# Altium schematic sheet 01_Power_Input.SchDoc
size 812 x 508 mm; SheetNumber: 1; SheetTotal: 16
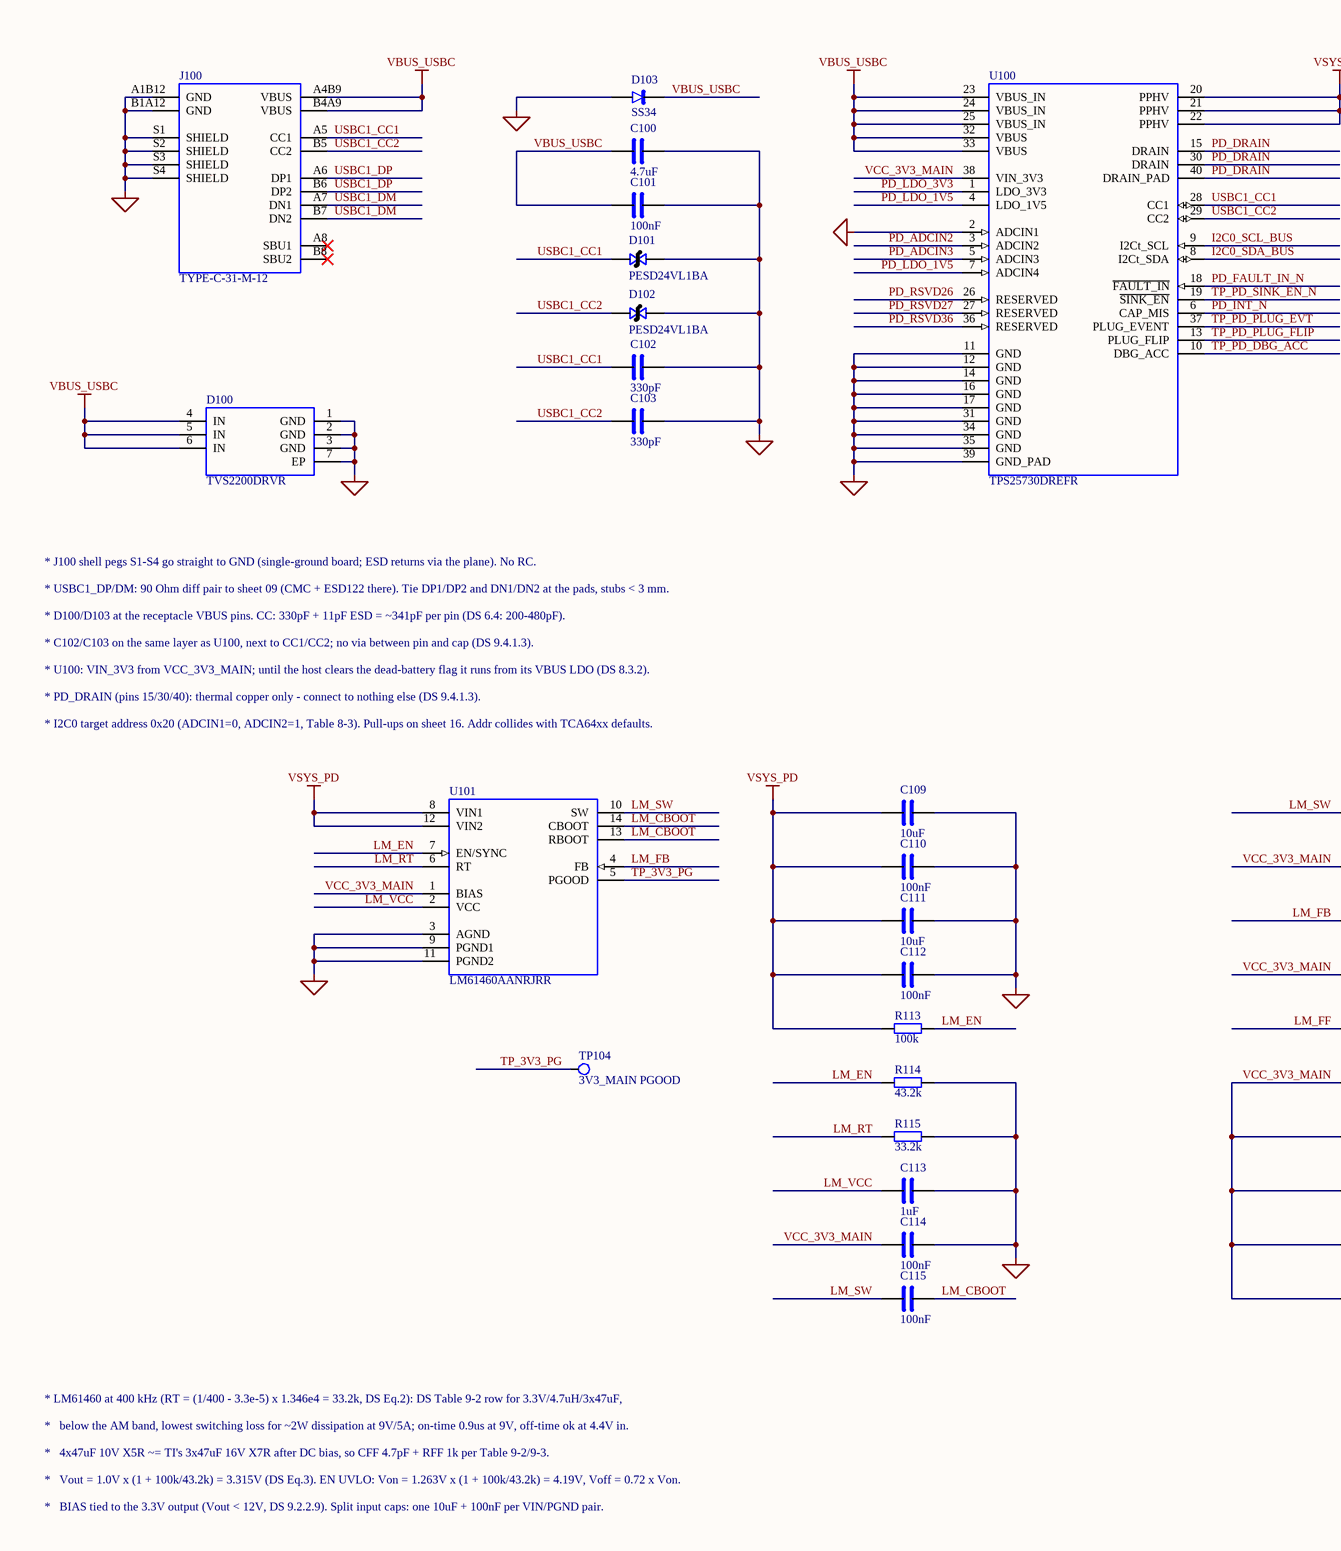
[diagram p0: 01_Power_Input.SchDoc, left]
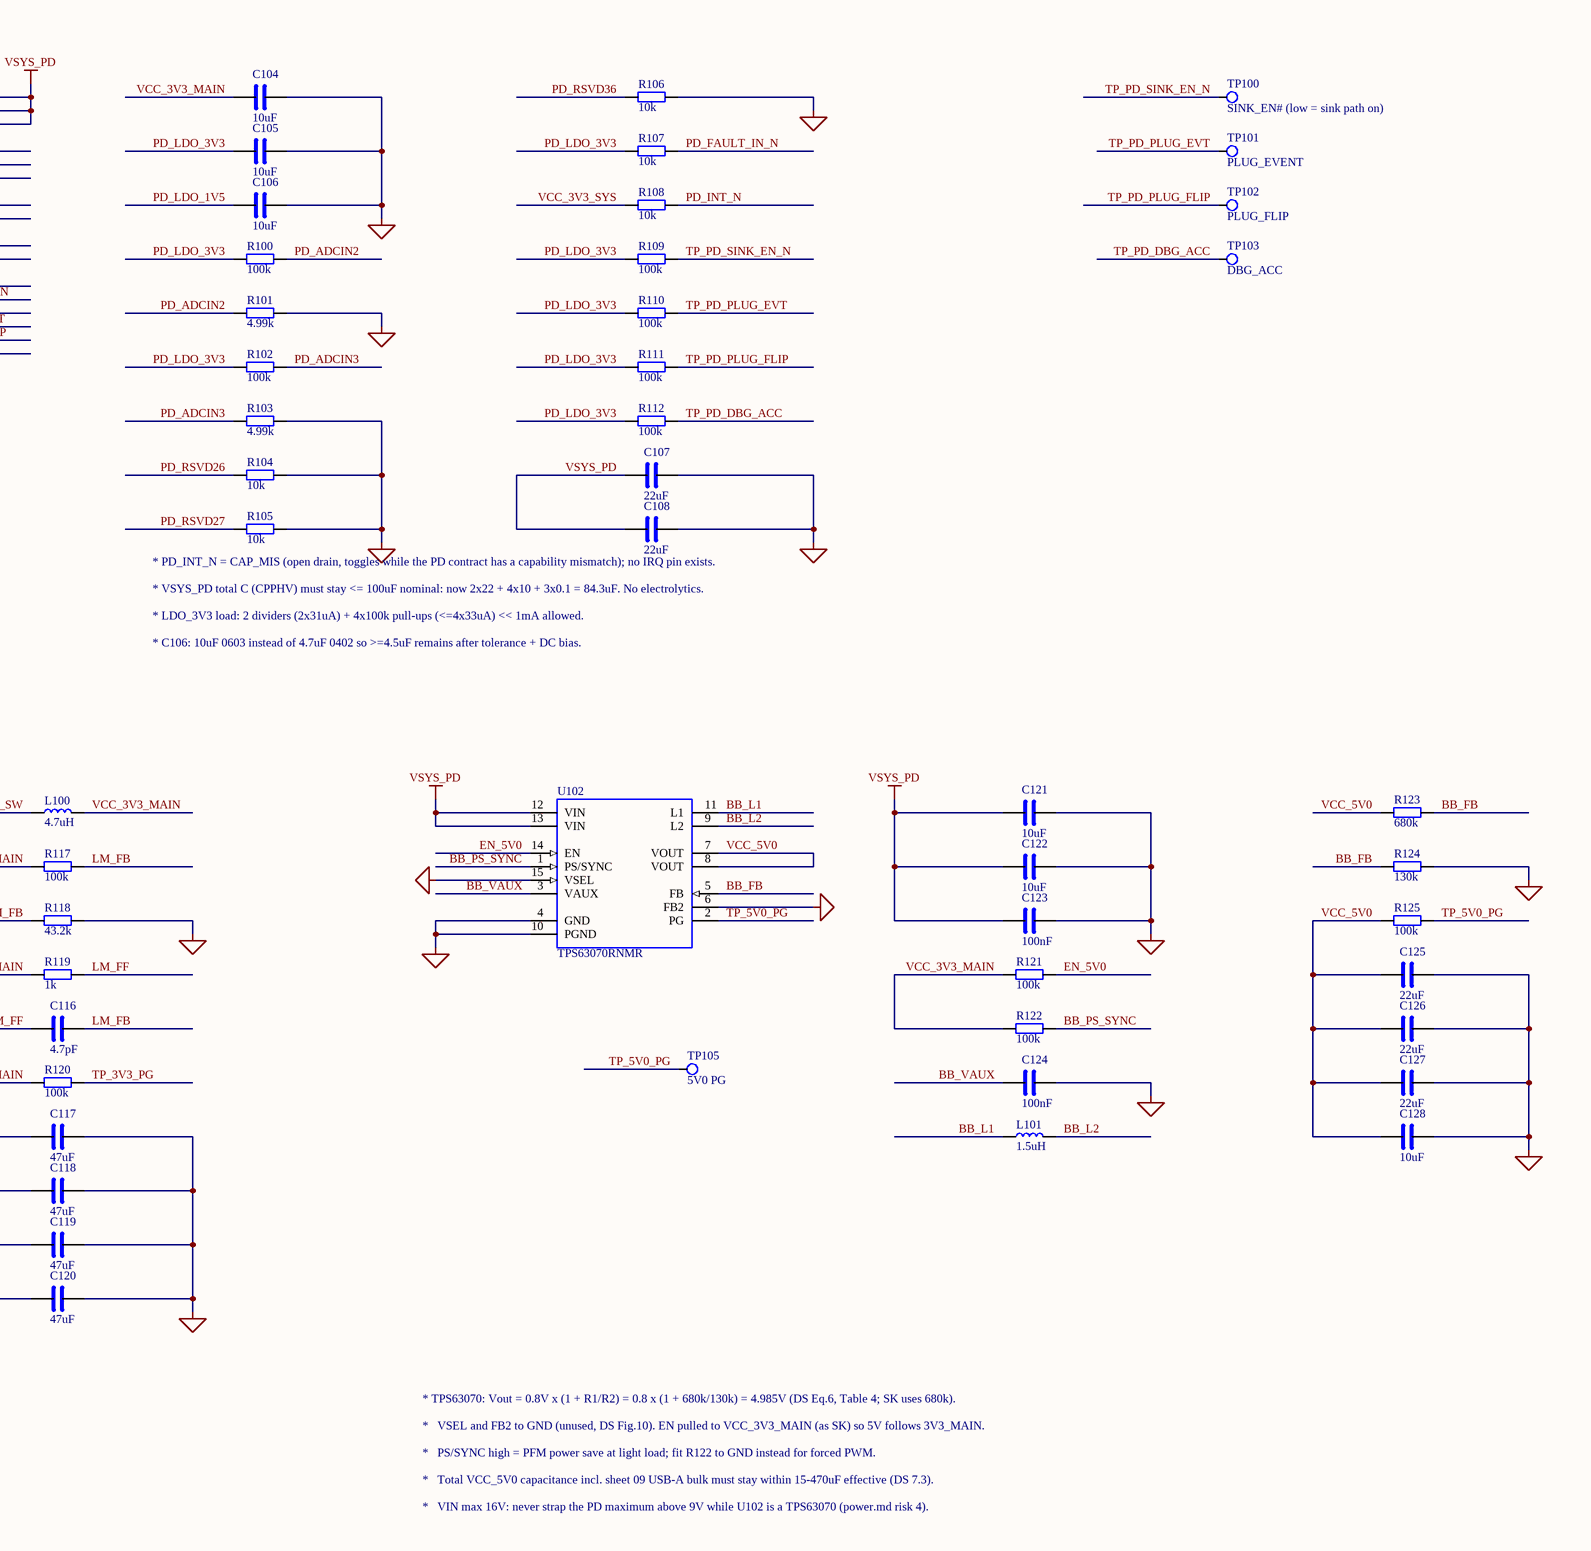
[diagram p1: 01_Power_Input.SchDoc, right]

## Parts
C100  4.7uF  [C0805]
C101  100nF  [C0603]
C102  330pF  [C0402]
C103  330pF  [C0402]
C104  10uF  [C0603]
C105  10uF  [C0603]
C106  10uF  [C0603]
C107  22uF  [C1206]
C108  22uF  [C1206]
C109  10uF  [C1206]
C110  100nF  [C0603]
C111  10uF  [C1206]
C112  100nF  [C0603]
C113  1uF  [C0402]
C114  100nF  [C0402]
C115  100nF  [C0402]
C116  4.7pF  [C0402]
C117  47uF  [C1206]
C118  47uF  [C1206]
C119  47uF  [C1206]
C120  47uF  [C1206]
C121  10uF  [C0805]
C122  10uF  [C0805]
C123  100nF  [C0603]
C124  100nF  [C0402]
C125  22uF  [C1206]
C126  22uF  [C1206]
C127  22uF  [C1206]
C128  10uF  [C0603]
D100  TVS2200DRVR  [WSON6_DRV_2X2]
D101  PESD24VL1BA  [SOD323]
D102  PESD24VL1BA  [SOD323]
D103  SS34  [DIO_SMA]
J100  TYPE-C-31-M-12  [USB-C_HRO_TYPE-C-31-M-12]
L100  4.7uH  [IND_SUNLORD_MWSA0603S]
L101  1.5uH  [IND_SUNLORD_MWSA0402S]
R100  100k  [R0402]
R101  4.99k  [R0402]
R102  100k  [R0402]
R103  4.99k  [R0402]
R104  10k  [R0402]
R105  10k  [R0402]
R106  10k  [R0402]
R107  10k  [R0402]
R108  10k  [R0402]
R109  100k  [R0402]
R110  100k  [R0402]
R111  100k  [R0402]
R112  100k  [R0402]
R113  100k  [R0402]
R114  43.2k  [R0402]
R115  33.2k  [R0402]
R117  100k  [R0402]
R118  43.2k  [R0402]
R119  1k  [R0402]
R120  100k  [R0402]
R121  100k  [R0402]
R122  100k  [R0402]
R123  680k  [R0402]
R124  130k  [R0402]
R125  100k  [R0402]
TP100  SINK_EN# (low = sink path on)  [TP_PAD_1.0]
TP101  PLUG_EVENT  [TP_PAD_1.0]
TP102  PLUG_FLIP  [TP_PAD_1.0]
TP103  DBG_ACC  [TP_PAD_1.0]
TP104  3V3_MAIN PGOOD  [TP_PAD_1.0]
TP105  5V0 PG  [TP_PAD_1.0]
U100  TPS25730DREFR  [WQFN38_REF_4X6]
U101  LM61460AANRJRR  [VQFN-HR14_RJR_3.5X4]
U102  TPS63070RNMR  [VQFN-HR15_RNM_2.5X3]

## Nets
GND: C100.2 C101.2 C102.2 C103.2 C104.2 C105.2 C106.2 C107.2 C108.2 C109.2 C110.2 C111.2 C112.2 C113.2 C114.2 C117.2 C118.2 C119.2 C120.2 C121.2 C122.2 C123.2 C124.2 C125.2 C126.2 C127.2 C128.2 D100.1(GND) D100.2(GND) D100.3(GND) D100.7(EP) D101.2 D102.2 D103.1(A) J100.A1B12(GND) J100.B1A12(GND) J100.S1(SHIELD) J100.S2(SHIELD) J100.S3(SHIELD) J100.S4(SHIELD) R101.2 R103.2 R104.2 R105.2 R106.2 R114.2 R115.2 R118.2 R124.2 U100.2(ADCIN1) U100.11(GND) U100.12(GND) U100.14(GND) U100.16(GND) U100.17(GND) U100.31(GND) U100.34(GND) U100.35(GND) U100.39(GND_PAD) U101.3(AGND) U101.9(PGND1) U101.11(PGND2) U102.4(GND) U102.6(FB2) U102.10(PGND) U102.15(VSEL)
VBUS_USBC: C100.1 C101.1 D100.4(IN) D100.5(IN) D100.6(IN) D103.2(K) J100.A4B9(VBUS) J100.B4A9(VBUS) U100.23(VBUS_IN) U100.24(VBUS_IN) U100.25(VBUS_IN) U100.32(VBUS) U100.33(VBUS)
VSYS_PD: C107.1 C108.1 C109.1 C110.1 C111.1 C112.1 C121.1 C122.1 C123.1 R113.1 U100.20(PPHV) U100.21(PPHV) U100.22(PPHV) U101.8(VIN1) U101.12(VIN2) U102.12(VIN) U102.13(VIN)
BB_FB: R123.2 R124.1 U102.5(FB)
BB_L1: L101.1 U102.11(L1)
BB_L2: L101.2 U102.9(L2)
BB_PS_SYNC: R122.2 U102.1(PS/SYNC)
BB_VAUX: C124.1 U102.3(VAUX)
EN_5V0: R121.2 U102.14(EN)
I2C0_SCL_BUS: U100.9(I2Ct_SCL)
I2C0_SDA_BUS: U100.8(I2Ct_SDA)
LM_CBOOT: C115.2 U101.13(RBOOT) U101.14(CBOOT)
LM_EN: R113.2 R114.1 U101.7(EN/SYNC)
LM_FB: C116.2 R117.2 R118.1 U101.4(FB)
LM_FF: C116.1 R119.2
LM_RT: R115.1 U101.6(RT)
LM_SW: C115.1 L100.1 U101.10(SW)
LM_VCC: C113.1 U101.2(VCC)
PD_ADCIN2: R100.2 R101.1 U100.3(ADCIN2)
PD_ADCIN3: R102.2 R103.1 U100.5(ADCIN3)
PD_DRAIN: U100.15(DRAIN) U100.30(DRAIN) U100.40(DRAIN_PAD)
PD_FAULT_IN_N: R107.2 U100.18(~{FAULT_IN})
PD_INT_N: R108.2 U100.6(CAP_MIS)
PD_LDO_1V5: C106.1 U100.4(LDO_1V5) U100.7(ADCIN4)
PD_LDO_3V3: C105.1 R100.1 R102.1 R107.1 R109.1 R110.1 R111.1 R112.1 U100.1(LDO_3V3)
PD_RSVD26: R104.1 U100.26(RESERVED)
PD_RSVD27: R105.1 U100.27(RESERVED)
PD_RSVD36: R106.1 U100.36(RESERVED)
TP_3V3_PG: R120.2 TP104.1(TP) U101.5(PGOOD)
TP_5V0_PG: R125.2 TP105.1(TP) U102.2(PG)
TP_PD_DBG_ACC: R112.2 TP103.1(TP) U100.10(DBG_ACC)
TP_PD_PLUG_EVT: R110.2 TP101.1(TP) U100.37(PLUG_EVENT)
TP_PD_PLUG_FLIP: R111.2 TP102.1(TP) U100.13(PLUG_FLIP)
TP_PD_SINK_EN_N: R109.2 TP100.1(TP) U100.19(~{SINK_EN})
USBC1_CC1: C102.1 D101.1 J100.A5(CC1) U100.28(CC1)
USBC1_CC2: C103.1 D102.1 J100.B5(CC2) U100.29(CC2)
USBC1_DM: J100.A7(DN1) J100.B7(DN2)
USBC1_DP: J100.A6(DP1) J100.B6(DP2)
VCC_3V3_MAIN: C104.1 C114.1 C117.1 C118.1 C119.1 C120.1 L100.2 R117.1 R119.1 R120.1 R121.1 R122.1 U100.38(VIN_3V3) U101.1(BIAS)
VCC_3V3_SYS: R108.1
VCC_5V0: C125.1 C126.1 C127.1 C128.1 R123.1 R125.1 U102.7(VOUT) U102.8(VOUT)

Not connected (* = marked no-connect by the designer): J100 A8(SBU1)* B8(SBU2)*

## Notes on the sheet
- * J100 shell pegs S1-S4 go straight to GND (single-ground board; ESD returns via the plane). No RC.
- * USBC1_DP/DM: 90 Ohm diff pair to sheet 09 (CMC + ESD122 there). Tie DP1/DP2 and DN1/DN2 at the pads, stubs < 3 mm.
- * PD_INT_N = CAP_MIS (open drain, toggles while the PD contract has a capability mismatch); no IRQ pin exists.
- * VSYS_PD total C (CPPHV) must stay <= 100uF nominal: now 2x22 + 4x10 + 3x0.1 = 84.3uF. No electrolytics.
- * D100/D103 at the receptacle VBUS pins. CC: 330pF + 11pF ESD = ~341pF per pin (DS 6.4: 200-480pF).
- * C102/C103 on the same layer as U100, next to CC1/CC2; no via between pin and cap (DS 9.4.1.3).
- * U100: VIN_3V3 from VCC_3V3_MAIN; until the host clears the dead-battery flag it runs from its VBUS LDO (DS 8.3.2).
- * LDO_3V3 load: 2 dividers (2x31uA) + 4x100k pull-ups (<=4x33uA) << 1mA allowed.
- * C106: 10uF 0603 instead of 4.7uF 0402 so >=4.5uF remains after tolerance + DC bias.
- * PD_DRAIN (pins 15/30/40): thermal copper only - connect to nothing else (DS 9.4.1.3).
- * I2C0 target address 0x20 (ADCIN1=0, ADCIN2=1, Table 8-3). Pull-ups on sheet 16. Addr collides with TCA64xx defaults.
- * LM61460 at 400 kHz (RT = (1/400 - 3.3e-5) x 1.346e4 = 33.2k, DS Eq.2): DS Table 9-2 row for 3.3V/4.7uH/3x47uF,
- * TPS63070: Vout = 0.8V x (1 + R1/R2) = 0.8 x (1 + 680k/130k) = 4.985V (DS Eq.6, Table 4; SK uses 680k).
- *   below the AM band, lowest switching loss for |W dissipation at 9V/5A; on-time 0.9us at 9V, off-time ok at 4.4V in.
- *   4x47uF 10V X5R ~= TI's 3x47uF 16V X7R after DC bias, so CFF 4.7pF + RFF 1k per Table 9-2/9-3.
- *   Vout = 1.0V x (1 + 100k/43.2k) = 3.315V (DS Eq.3). EN UVLO: Von = 1.263V x (1 + 100k/43.2k) = 4.19V, Voff = 0.72 x Von.
- *   VSEL and FB2 to GND (unused, DS Fig.10). EN pulled to VCC_3V3_MAIN (as SK) so 5V follows 3V3_MAIN.
- *   PS/SYNC high = PFM power save at light load; fit R122 to GND instead for forced PWM.
- *   Total VCC_5V0 capacitance incl. sheet 09 USB-A bulk must stay within 15-470uF effective (DS 7.3).
- *   BIAS tied to the 3.3V output (Vout < 12V, DS 9.2.2.9). Split input caps: one 10uF + 100nF per VIN/PGND pair.
- *   VIN max 16V: never strap the PD maximum above 9V while U102 is a TPS63070 (power.md risk 4).

## Library data of the parts
C100 = CAP: Capacitor, non-polarized; MPN: CL21A475KAQNNNE; Manufacturer: Samsung; Spec: 4.7uF 25V X5R 0805 (CVBUS; total VBUS C must stay <= 10 uF)
C101 = CAP: Capacitor, non-polarized; MPN: CC0603KRX7R9BB104; Manufacturer: YAGEO; Spec: 100nF 50V X7R 0603 (VBUS HF)
C102 C103 = CAP: Capacitor, non-polarized; Spec: 330pF 50V C0G 0402 (CCCy)
C104 = CAP: Capacitor, non-polarized; MPN: CL10A106KP8NNNC; Manufacturer: Samsung; Spec: 10uF 10V X5R 0603 (CVIN_3V3)
C105 = CAP: Capacitor, non-polarized; MPN: CL10A106KP8NNNC; Manufacturer: Samsung; Spec: 10uF 10V X5R 0603 (CLDO_3V3 5-25uF)
C106 = CAP: Capacitor, non-polarized; MPN: CL10A106KP8NNNC; Manufacturer: Samsung; Spec: 10uF 10V X5R 0603 (CLDO_1V5 4.5-12uF)
C107 C108 = CAP: Capacitor, non-polarized; MPN: CL31A226KAHNNNE; Manufacturer: Samsung; Spec: 22uF 25V X5R 1206 (CPPHV bulk)
C109 = CAP: Capacitor, non-polarized; MPN: CL31A106KBHNNNE; Manufacturer: Samsung; Spec: 10uF 50V X5R 1206 (VIN1/PGND1)
C110 = CAP: Capacitor, non-polarized; MPN: CC0603KRX7R9BB104; Manufacturer: YAGEO; Spec: 100nF 50V X7R 0603 (VIN1/PGND1 HF)
C111 = CAP: Capacitor, non-polarized; MPN: CL31A106KBHNNNE; Manufacturer: Samsung; Spec: 10uF 50V X5R 1206 (VIN2/PGND2)
C112 = CAP: Capacitor, non-polarized; MPN: CC0603KRX7R9BB104; Manufacturer: YAGEO; Spec: 100nF 50V X7R 0603 (VIN2/PGND2 HF)
C113 = CAP: Capacitor, non-polarized; Spec: 1uF 25V X5R 0402 (VCC)
C114 = CAP: Capacitor, non-polarized; Spec: 100nF 16V X7R 0402 (at BIAS pin)
C115 = CAP: Capacitor, non-polarized; Spec: 100nF 16V X7R 0402 (CBOOT)
C116 = CAP: Capacitor, non-polarized; Spec: 4.7pF 50V C0G 0402 (CFF)
C117-C120 = CAP: Capacitor, non-polarized; MPN: CL31A476MPHNNNE; Manufacturer: Samsung; Spec: 47uF 10V X5R 1206 (COUT)
C121 C122 = CAP: Capacitor, non-polarized; MPN: CL21A106KAYNNNE; Manufacturer: Samsung; Spec: 10uF 25V X5R 0805 (CIN)
C123 = CAP: Capacitor, non-polarized; MPN: CC0603KRX7R9BB104; Manufacturer: YAGEO; Spec: 100nF 50V X7R 0603 (VIN HF, at pins)
C124 = CAP: Capacitor, non-polarized; Spec: 100nF 16V X7R 0402 (VAUX)
C125-C127 = CAP: Capacitor, non-polarized; MPN: CL31A226KAHNNNE; Manufacturer: Samsung; Spec: 22uF 25V X5R 1206 (COUT)
C128 = CAP: Capacitor, non-polarized; MPN: CL10A106KP8NNNC; Manufacturer: Samsung; Spec: 10uF 10V X5R 0603 (VOUT bypass at pins)
D100 = TVS2200_DRV: TVS2200 22 V flat-clamp surge protection, WSON-6 2x2; Manufacturer: Texas Instruments; MPN: TVS2200DRVR
D101 = TVS_BI: Bidirectional TVS / ESD diode; MPN: PESD24VL1BA,115; Manufacturer: Nexperia; Spec: PESD24VL1BA CC1 ESD (11pF)
D102 = TVS_BI: Bidirectional TVS / ESD diode; MPN: PESD24VL1BA,115; Manufacturer: Nexperia; Spec: PESD24VL1BA CC2 ESD (11pF)
D103 = DIODE: Diode (pin 1 = anode); Manufacturer: MDD; Spec: SS34 40V 3A Schottky (TPS25730 DS 8.5); MPN: SS34
J100 = TYPE-C-31-M-12: USB Type-C receptacle, USB 2.0 16-contact, SMD R/A, 4 THT shell pegs; Manufacturer: Korean Hroparts Elec; MPN: TYPE-C-31-M-12
L100 = IND: Inductor; MPN: MWSA0603S-4R7MT; Manufacturer: Sunlord; Spec: 4.7uH MWSA0603S-4R7MT (Isat 9A, 33mOhm)
L101 = IND: Inductor; MPN: MWSA0402S-1R5MT; Manufacturer: Sunlord; Spec: 1.5uH MWSA0402S-1R5MT (Isat 5.5A)
R100 = RES: Resistor; Spec: 100k 1% 0402 (ADCIN2 up)
R101 = RES: Resistor; Spec: 4.99k 1% 0402 (ADCIN2 dn: max 9V)
R102 = RES: Resistor; Spec: 100k 1% 0402 (ADCIN3 up)
R103 = RES: Resistor; Spec: 4.99k 1% 0402 (ADCIN3 dn: 1.5A op)
R104-R106 = RES: Resistor; Spec: 10k 1% 0402 (RESERVED)
R107 = RES: Resistor; Spec: 10k 1% 0402 (FAULT_IN high = no fault)
R108 = RES: Resistor; Spec: 10k 1% 0402 (SoC-side pull-up)
R109-R112 = RES: Resistor; Spec: 100k 1% 0402
R113 = RES: Resistor; Spec: 100k 1% 0402 (RENT)
R114 = RES: Resistor; Spec: 43.2k 1% 0402 (RENB: UVLO on 4.19V, off 3.0V)
R115 = RES: Resistor; Spec: 33.2k 1% 0402 (RT: 400kHz)
R117 = RES: Resistor; Spec: 100k 1% 0402 (RFBT)
R118 = RES: Resistor; Spec: 43.2k 1% 0402 (RFBB: 3.315V)
R119 = RES: Resistor; Spec: 1k 1% 0402 (RFF)
R120 = RES: Resistor; Spec: 100k 1% 0402 (PGOOD pull-up)
R121 = RES: Resistor; Spec: 100k 1% 0402 (EN: on with 3V3_MAIN)
R122 = RES: Resistor; Spec: 100k 1% 0402 (PS high: power save)
R123 = RES: Resistor; Spec: 680k 1% 0402 (R1)
R124 = RES: Resistor; Spec: 130k 1% 0402 (R2: 4.985V)
R125 = RES: Resistor; Spec: 100k 1% 0402 (PG pull-up)
TP100-TP105 = TESTPOINT: Test point
U100 = TPS25730D_REF: TPS25730D USB-C PD sink controller, 5 A integrated power path, WQFN-38 REF; Manufacturer: Texas Instruments; MPN: TPS25730DREFR
U101 = LM61460_RJR: LM61460 36 V 6 A synchronous buck, adjustable, VQFN-HR-14 RJR; Manufacturer: Texas Instruments; MPN: LM61460AANRJRR
U102 = TPS63070_RNM: TPS63070 2-16 V 3.6 A buck-boost, adjustable, VQFN-HR-15 RNM; Manufacturer: Texas Instruments; MPN: TPS63070RNMR